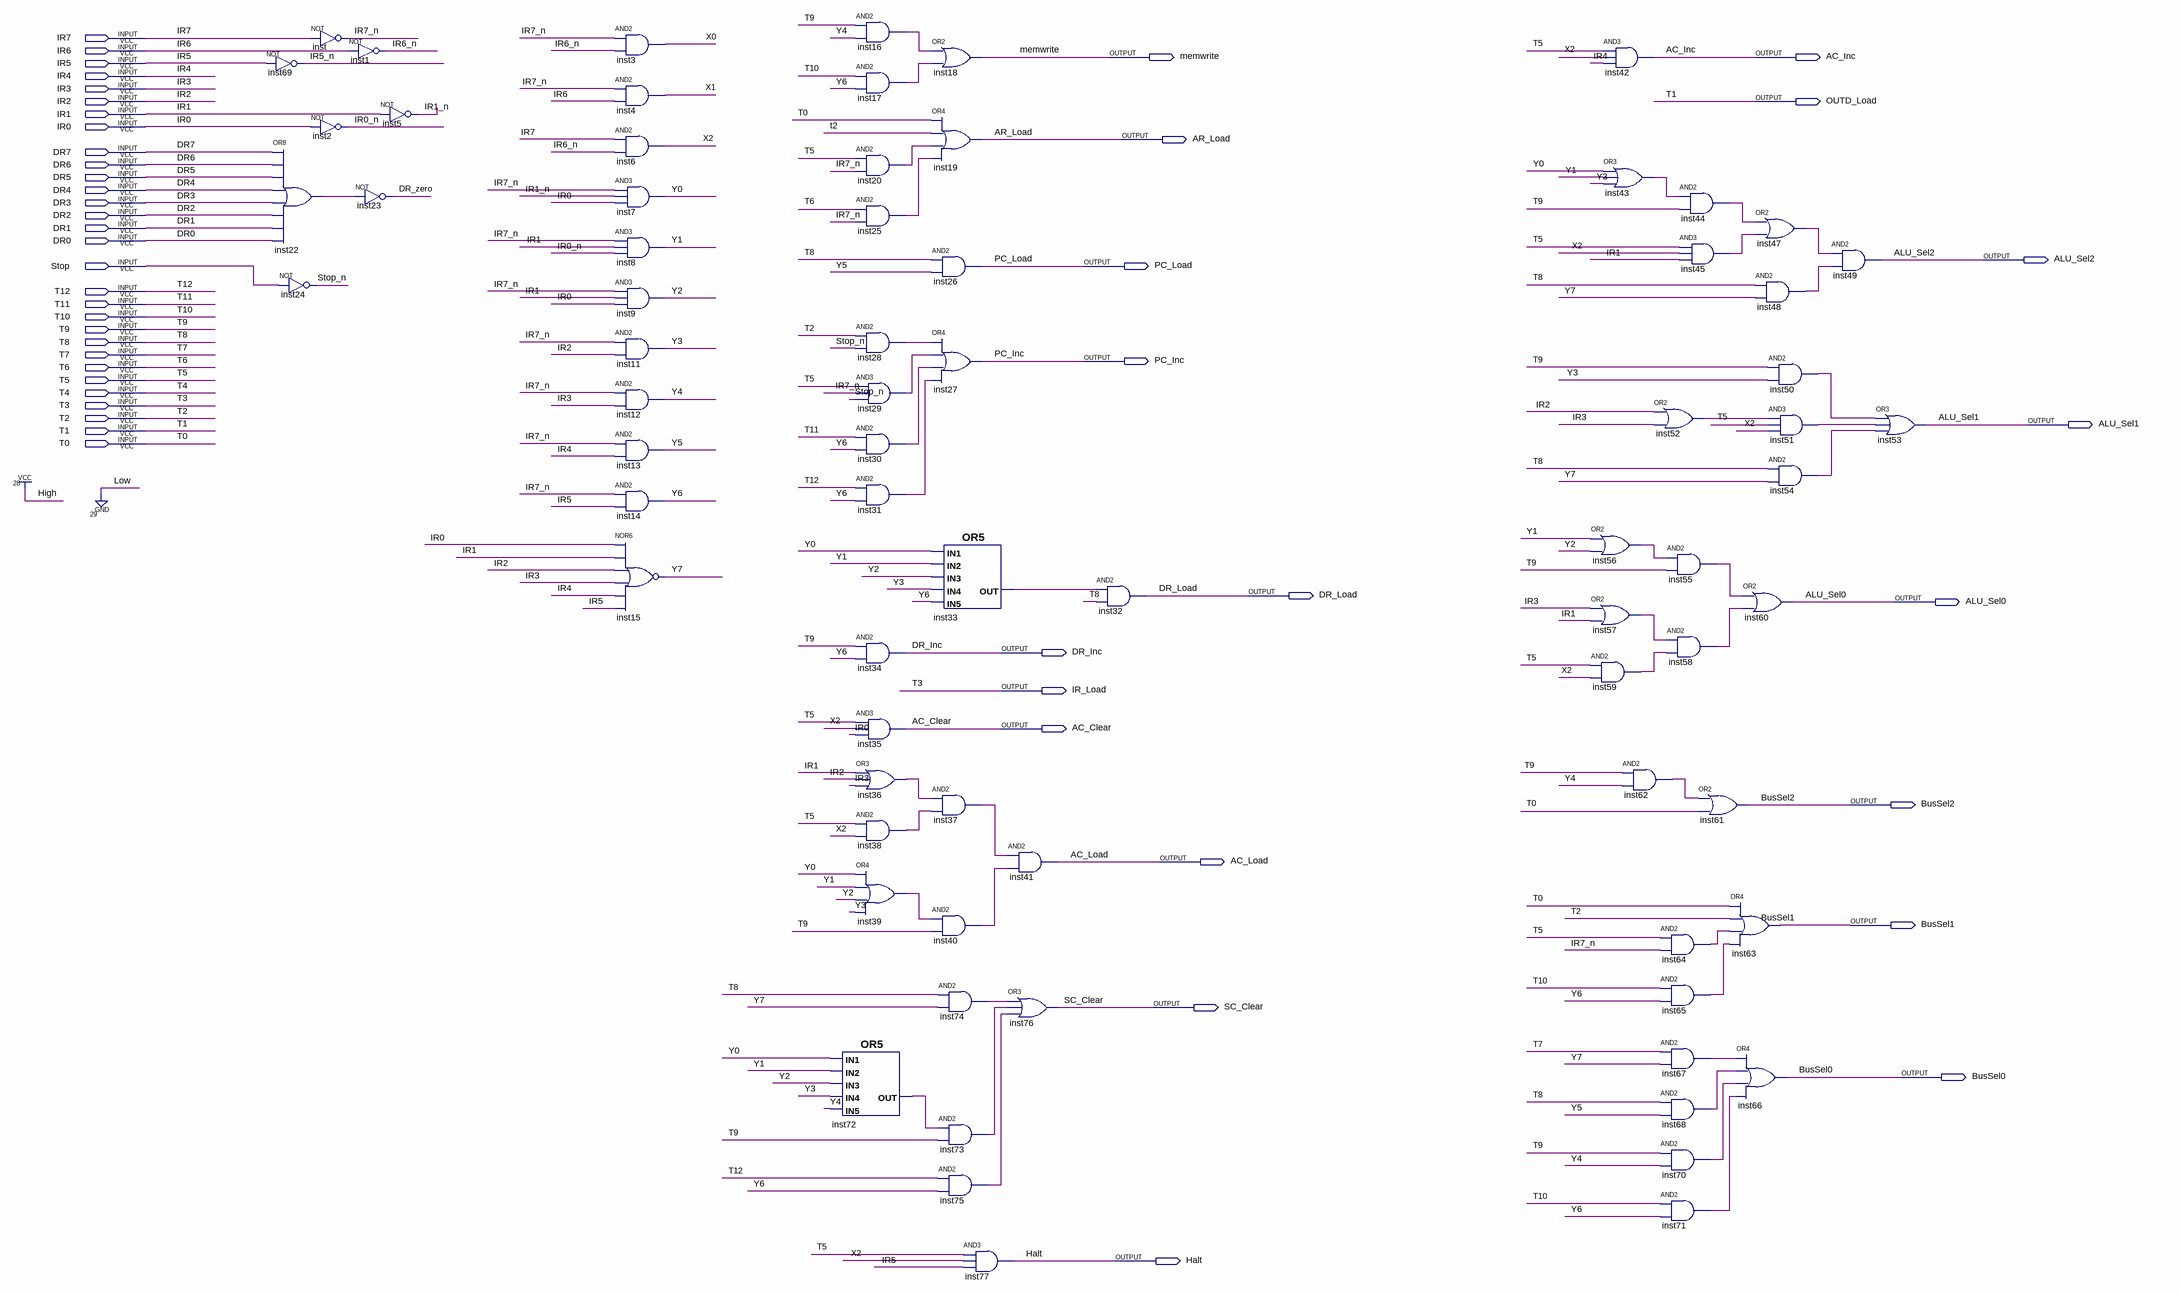
[diagram p0: schematic sheet]
// Quartus schematic lab4controller.before.bdf as structural Verilog: 75 symbols, 49 pins
module \lab4controller.before  (
  input  IR7,
  input  IR6,
  input  IR5,
  input  IR4,
  input  IR3,
  input  IR2,
  input  IR1,
  input  IR0,
  input  DR7,
  input  DR6,
  input  DR5,
  input  DR4,
  input  DR3,
  input  DR2,
  input  DR1,
  input  DR0,
  input  Stop,
  input  T12,
  input  T11,
  input  T10,
  input  T9,
  input  T8,
  input  T7,
  input  T6,
  input  T5,
  input  T4,
  input  T3,
  input  T2,
  input  T1,
  input  T0,
  output memwrite,
  output AC_Inc,
  output OUTD_Load,
  output AR_Load,
  output ALU_Sel2,
  output PC_Load,
  output PC_Inc,
  output ALU_Sel1,
  output DR_Load,
  output ALU_Sel0,
  output DR_Inc,
  output IR_Load,
  output AC_Clear,
  output BusSel2,
  output AC_Load,
  output BusSel1,
  output SC_Clear,
  output BusSel0,
  output Halt
);

  wire DR_zero, inst16_out, inst17_out, inst20_out, inst22_out, inst25_out, inst28_out, inst29_out,
       inst30_out, inst31_out, inst33_out, inst36_out, inst37_out, inst38_out, inst39_out, inst40_out,
       inst43_out, inst44_out, inst45_out, inst47_out, inst48_out, inst50_out, inst51_out, inst52_out,
       inst54_out, inst55_out, inst56_out, inst57_out, inst58_out, inst59_out, inst62_out, inst64_out,
       inst65_out, inst67_out, inst68_out, inst70_out, inst71_out, inst72_out, inst73_out, inst74_out,
       inst75_out, IR0_n, IR1_n, IR5_n, IR6_n, IR7_n, Stop_n, X0, X1, X2, Y0, Y1, Y2, Y3, Y4, Y5, Y6, Y7;

  not inst69 (IR5_n, IR5);
  or inst22 (inst22_out, DR7, DR6, DR5, DR4, DR3, DR2, DR1, DR0);
  not inst24 (Stop_n, Stop);
  not inst (IR7_n, IR7);
  not inst2 (IR0_n, IR0);
  not inst1 (IR6_n, IR6);
  not inst5 (IR1_n, IR1);
  not inst23 (DR_zero, inst22_out);
  and inst3 (X0, IR7_n, IR6_n);
  and inst4 (X1, IR7_n, IR6);
  and inst6 (X2, IR7, IR6_n);
  and inst7 (Y0, IR7_n, IR1_n, IR0);
  and inst8 (Y1, IR7_n, IR1, IR0_n);
  and inst9 (Y2, IR7_n, IR1, IR0);
  and inst11 (Y3, IR7_n, IR2);
  and inst12 (Y4, IR7_n, IR3);
  and inst13 (Y5, IR7_n, IR4);
  and inst14 (Y6, IR7_n, IR5);
  nor inst15 (Y7, IR0, IR1, IR2, IR3, IR4, IR5);
  or inst72 (inst72_out, Y0, Y1, Y2, Y3, Y4);
  and inst16 (inst16_out, T9, Y4);
  and inst17 (inst17_out, T10, Y6);
  and inst20 (inst20_out, T5, IR7_n);
  and inst25 (inst25_out, T6, IR7_n);
  and inst28 (inst28_out, T2, Stop_n);
  and inst29 (inst29_out, T5, IR7_n, Stop_n);
  and inst30 (inst30_out, T11, Y6);
  and inst31 (inst31_out, T12, Y6);
  and inst34 (DR_Inc, T9, Y6);
  and inst35 (AC_Clear, T5, X2, IR0);
  or inst36 (inst36_out, IR1, IR2, IR3);
  and inst38 (inst38_out, T5, X2);
  or inst39 (inst39_out, Y0, Y1, Y2, Y3);
  or inst18 (memwrite, inst16_out, inst17_out);
  or inst19 (AR_Load, T0, T2, inst20_out, inst25_out);
  and inst26 (PC_Load, T8, Y5);
  or inst27 (PC_Inc, inst28_out, inst29_out, inst30_out, inst31_out);
  or inst33 (inst33_out, Y0, Y1, Y2, Y3, Y6);
  and inst37 (inst37_out, inst36_out, inst38_out);
  and inst40 (inst40_out, inst39_out, T9);
  and inst74 (inst74_out, T8, Y7);
  and inst73 (inst73_out, inst72_out, T9);
  and inst75 (inst75_out, T12, Y6);
  and inst77 (Halt, T5, X2, IR5);
  and inst41 (AC_Load, inst37_out, inst40_out);
  or inst76 (SC_Clear, inst74_out, inst73_out, inst75_out);
  and inst32 (DR_Load, inst33_out, T8);
  and inst42 (AC_Inc, T5, X2, IR4);
  or inst43 (inst43_out, Y0, Y1, Y3);
  or inst56 (inst56_out, Y1, Y2);
  or inst57 (inst57_out, IR3, IR1);
  and inst59 (inst59_out, T5, X2);
  or inst52 (inst52_out, IR2, IR3);
  and inst62 (inst62_out, T9, Y4);
  and inst44 (inst44_out, inst43_out, T9);
  and inst45 (inst45_out, T5, X2, IR1);
  and inst55 (inst55_out, inst56_out, T9);
  and inst58 (inst58_out, inst57_out, inst59_out);
  or inst61 (BusSel2, inst62_out, T0);
  and inst64 (inst64_out, T5, IR7_n);
  and inst65 (inst65_out, T10, Y6);
  and inst67 (inst67_out, T7, Y7);
  and inst68 (inst68_out, T8, Y5);
  and inst70 (inst70_out, T9, Y4);
  and inst71 (inst71_out, T10, Y6);
  or inst47 (inst47_out, inst44_out, inst45_out);
  and inst48 (inst48_out, T8, Y7);
  or inst60 (ALU_Sel0, inst55_out, inst58_out);
  or inst63 (BusSel1, T0, T2, inst64_out, inst65_out);
  or inst66 (BusSel0, inst67_out, inst68_out, inst70_out, inst71_out);
  and inst50 (inst50_out, T9, Y3);
  and inst51 (inst51_out, inst52_out, T5, X2);
  and inst54 (inst54_out, T8, Y7);
  and inst49 (ALU_Sel2, inst47_out, inst48_out);
  or inst53 (ALU_Sel1, inst50_out, inst51_out, inst54_out);

  assign IR_Load = T3;
  assign OUTD_Load = T1;
endmodule
